# Altium schematic sheet Sheet1.SchDoc
size A4; SheetNumber: 1; SheetTotal: 2
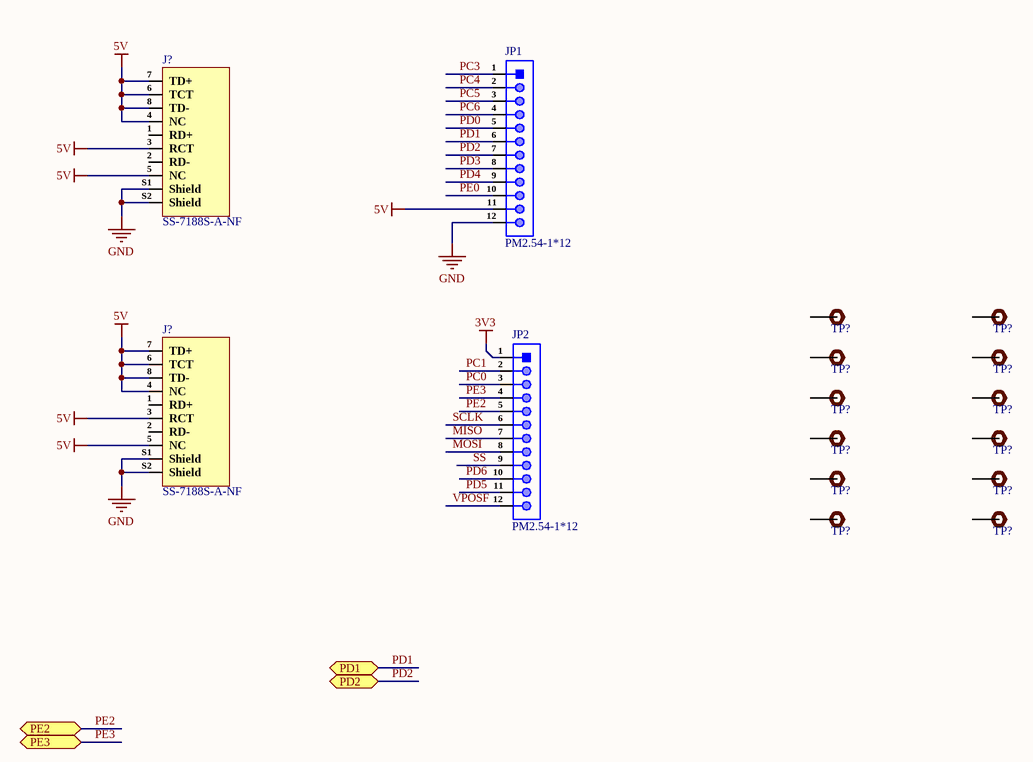
[diagram p0: Sheet1.SchDoc]

## Parts
(Parts that share a designator on the sheet are numbered #1, #2 ... from top to bottom, then left to right.)
J?#1  SS-7188S-A-NF  [SS-7188S-A-NF]
J?#2  SS-7188S-A-NF  [SS-7188S-A-NF]
JP1  PM2.54-1*12  [HDR 1x12 TH (Female)]
JP2  PM2.54-1*12  [HDR 1x12 TH (Female)]
TP?#1  TEST POINT  [Test-point]  (value not drawn)  (no BOM)
TP?#2  TEST POINT  [Test-point]  (value not drawn)  (no BOM)
TP?#3  TEST POINT  [Test-point]  (value not drawn)  (no BOM)
TP?#4  TEST POINT  [Test-point]  (value not drawn)  (no BOM)
TP?#5  TEST POINT  [Test-point]  (value not drawn)  (no BOM)
TP?#6  TEST POINT  [Test-point]  (value not drawn)  (no BOM)
TP?#7  TEST POINT  [Test-point]  (value not drawn)  (no BOM)
TP?#8  TEST POINT  [Test-point]  (value not drawn)  (no BOM)
TP?#9  TEST POINT  [Test-point]  (value not drawn)  (no BOM)
TP?#10  TEST POINT  [Test-point]  (value not drawn)  (no BOM)
TP?#11  TEST POINT  [Test-point]  (value not drawn)  (no BOM)
TP?#12  TEST POINT  [Test-point]  (value not drawn)  (no BOM)

## Ports
PD1 (bidir, see Sheet2[1D]), PD2 (bidir, see Sheet2[1D]), PE2 (bidir, see Sheet2[1D]), PE3 (bidir, see Sheet2[1D])

## Nets
3V3: JP2.1
5V: J?#1.3(RCT) J?#1.4(NC) J?#1.5(NC) J?#1.6(TCT) J?#1.7(TD+) J?#1.8(TD-) J?#2.3(RCT) J?#2.4(NC) J?#2.5(NC) J?#2.6(TCT) J?#2.7(TD+) J?#2.8(TD-) JP1.11
GND: J?#1.S1(Shield) J?#1.S2(Shield) J?#2.S1(Shield) J?#2.S2(Shield) JP1.12
MISO: JP2.7
MOSI: JP2.8
PC0: JP2.3
PC1: JP2.2
PC3: JP1.1
PC4: JP1.2
PC5: JP1.3
PC6: JP1.4
PD0: JP1.5
PD1: JP1.6 ; port PD1
PD2: JP1.7 ; port PD2
PD3: JP1.8
PD4: JP1.9
PD5: JP2.11
PD6: JP2.10
PE0: JP1.10
PE2: JP2.5 ; port PE2
PE3: JP2.4 ; port PE3
SCLK: JP2.6
SS: JP2.9
VPOSF: JP2.12

Not connected (* = marked no-connect by the designer): J?#1 1(RD+) 2(RD-); J?#2 1(RD+) 2(RD-); TP?#1 1; TP?#2 1; TP?#3 1; TP?#4 1; TP?#5 1; TP?#6 1; TP?#7 1; TP?#8 1; TP?#9 1; TP?#10 1; TP?#11 1; TP?#12 1

## Notes on the sheet
- File:
- Title:
- Date:
- Page
- Num:
- Total:
- Drawn By: Huzaifa Ali

## Library data of the parts
J?#1 J?#2 = SS-7188S-A-NF: CONN MOD JACK 8P8C R/A SHIELDED; Manufacturer: Bel; Item Type: Connectors; Supplier: Digikey; Supplier Part Number: 380-1047-ND; Manufacturer Part Number: SS-7188S-A-NF; RoHS: Yes; Stock: 8195; Pricing: 1=2.36, 10=2.058, 33=1.9703, 66=1.92652, 132=1.83894, 264=1.66379, 528=1.53242, 1023=1.31351, 2508=1.22594 (USD); Lead Free: 5698LeadFree; ComponentLink1URL: https://datasheet.ciiva.com/11726/0900766b8001c3e8-11726092.pdf?src-supplier=Rs; ComponentLink1Description: https://datasheet.ciiva.com/11726/0900766b8001c3e8-11726092.pdf?src-supplier=Rs; ComponentLink2URL: https://datasheet.ciiva.com/685/ct710001-685643.pdf?src-supplier=Digikey; ComponentLink2Description: https://datasheet.ciiva.com/685/ct710001-685643.pdf?src-supplier=Digikey; ComponentLink3URL: https://datasheet.ciiva.com/26934/getdatasheetpartid-781435-26934401.pdf?src-supplier=Verical; ComponentLink3Description: https://datasheet.ciiva.com/26934/getdatasheetpartid-781435-26934401.pdf?src-supplier=Verical; ComponentLink4URL: https://datasheet.ciiva.com/3138/ct710001-3138744.pdf?src-supplier=Avnet; ComponentLink4Description: https://datasheet.ciiva.com/3138/ct710001-3138744.pdf?src-supplier=Avnet; ComponentLink5URL: https://datasheet.ciiva.com/15170/getdatasheetpartid-79418-15170477.pdf?src-supplier=Verical; ComponentLink5Description: https://datasheet.ciiva.com/15170/getdatasheetpartid-79418-15170477.pdf?src-supplier=Verical
JP1 JP2 = PM2.54-1*12: 2.54mm 2.54mm Plugin 2.5A 12P -40℃~+105℃ Straight 1x12P Top 8.5mm Square Hole Plugin,P=2.54mm Female Headers ROHS; Manufacturer: ZHOURI; Manufacturer Part Number: PM2.54-1*12; Package: Plugin,P=2.54mm; LCSC Part Number: C5224029; Item Type: Female Header; ComponentLink1Description: LCSC; ComponentLink1URL: https://www.lcsc.com/product-detail/span-style-background-color-ff0-Female-span-Headers_ZHOURI-PM2-54-1-12_C5224029.html
TP?#1-TP?#12 = TEST POINT: Test Point ON; Item Type: TEST POINT